# Altium schematic sheet 09_Power.SchDoc
size A3; SheetNumber: 10; SheetTotal: 13; SPICEModelCacheYARKVBEJ: <root> / <DocumentId>YARKVBEJ</DocumentId> / </root>
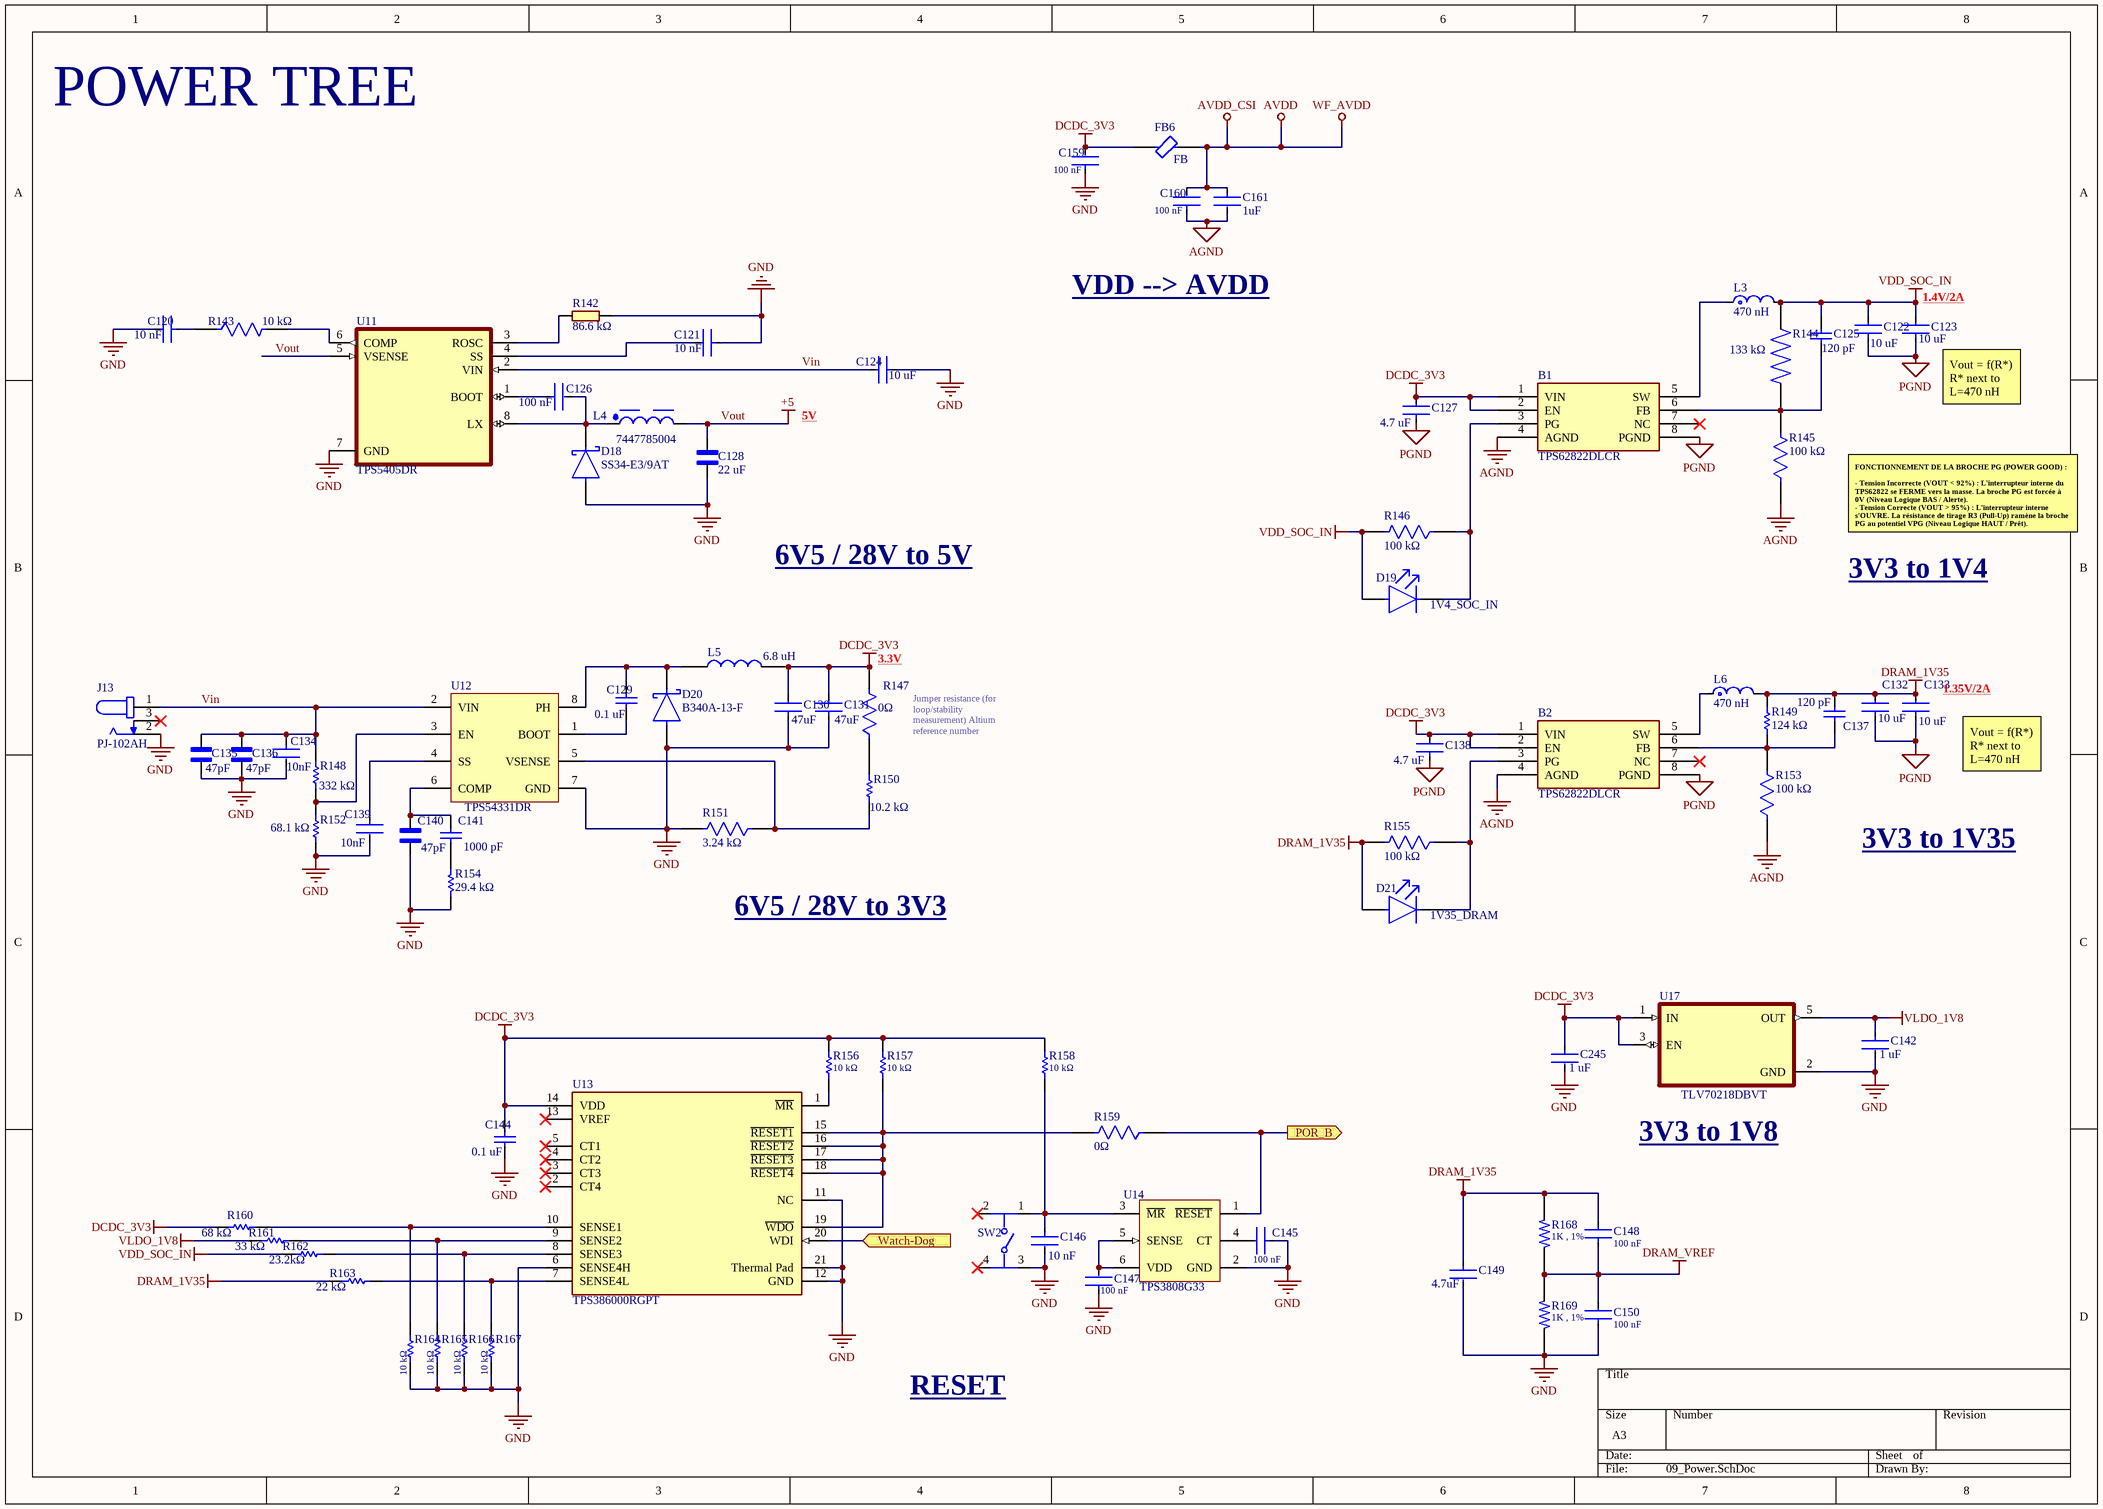
[diagram p0: 09_Power.SchDoc]

## Parts
B1  TPS62822DLCR  [SON50P150X200X100-8N]
B2  TPS62822DLCR  [SON50P150X200X100-8N]
C120  10 nF  [FP-CC0603-DA-MFG]
C121  10 nF  [FP-CC0603-DA-MFG]
C122  10 uF  [FP-GRM188-0_2-IPC_B]
C123  10 uF  [FP-GRM188-0_2-IPC_B]
C124  10 uF  [FP-GRM188-0_2-IPC_B]
C125  120 pF  [CAPC1608X90X35NL10T15]
C126  100 nF  [FP-CC0603-DA-MFG]
C127  4.7 uF  [FP-0603-L_1_6_0_2-W_0_8_0-IPC_B]
C128  22 uF  [CAPC3216X110N]
C129  0.1 uF  [CAPC1608X90X35ML10T15]
C130  47uF  [FP-GRM188-0_2-IPC_B]
C131  47uF  [FP-GRM188-0_2-IPC_B]
C132  10 uF  [FP-GRM188-0_2-IPC_B]
C133  10 uF  [FP-GRM188-0_2-IPC_B]
C134  10nF  [FP-CC0603-DA-MFG]
C135  47pF  [CAPC1608X90]
C136  47pF  [CAPC1608X90]
C137  120 pF  [CAPC1608X90X35NL10T15]
C138  4.7 uF  [FP-0603-L_1_6_0_2-W_0_8_0-IPC_B]
C139  10nF  [FP-CC0603-DA-MFG]
C140  47pF  [CAPC1608X90]
C141  1000 pF  [CAPC1608X90X35NL10T15]
C142  1 uF  [FP-CC0603-DA-MFG]
C144  0.1 uF  [CAPC1608X90X35ML10T15]
C145  100 nF  [FP-CC0603-DA-MFG]
C146  10 nF  [FP-CC0603-DA-MFG]
C147  100 nF  [FP-CC0603-DA-MFG]
C148  100 nF  [FP-CC0603-DA-MFG]
C149  4.7uF  [FP-CC0603-DA-MFG]
C150  100 nF  [FP-CC0603-DA-MFG]
C159  100 nF  [FP-CC0603-DA-MFG]
C160  100 nF  [FP-CC0603-DA-MFG]
C161  1uF  [FP-CC0603-DA-MFG]
C245  1 uF  [FP-CC0603-DA-MFG]
D18  SS34-E3/9AT  [FP-SMC-MFG]
D19  1V4_SOC_IN  [FP-HSMC-C280-MFG]
D20  B340A-13-F  [FP-SMA-MFG]
D21  1V35_DRAM  [FP-HSMG-C150-MFG]
FB6  FB  [FP-BLM18-0_15-t0_8-IPC_A]
J13  PJ-102AH  [CUI_PJ-102AH]
L3  470 nH  [FP-XFL4015-MFG]
L4  7447785004  [WE-PD_6033R]
L5  6.8 uH  [IND_SPM10054T_TDK]
L6  470 nH  [FP-XFL4015-MFG]
R142  86.6 kΩ  [0603]
R143  10 kΩ  [FP-RC0603-0_55-MFG]
R144  133 kΩ  [RESC1608X55N]
R145  100 kΩ  [FP-RC0603-0_55-MFG]
R146  100 kΩ  [FP-RC0603-0_55-MFG]
R147  0Ω  [FP-RC0603-MFG]
R148  332 kΩ  [RESC1608X55X25ML10T15]
R149  124 kΩ  [RESC1608X55X25NL10T15]
R150  10.2 kΩ  [RESC1608X55X25LL10T15]
R151  3.24 kΩ  [FP-CRCW0603-e3-IPC_A]
R152  68.1 kΩ  [RESC1608X55X25LL10T15]
R153  100 kΩ  [FP-RC0603-0_55-MFG]
R154  29.4 kΩ  [RESC1608X55X25ML10T15]
R155  100 kΩ  [FP-RC0603-0_55-MFG]
R156  10 kΩ  [RESC1608X55X25ML10T15]
R157  10 kΩ  [RESC1608X55X25ML10T15]
R158  10 kΩ  [RESC1608X55X25ML10T15]
R159  0Ω  [FP-RC0603-MFG]
R160  68 kΩ  [RESC1608X55X25LL10T15]
R161  33 kΩ  [RESC1608X55X25LL10T15]
R162  23.2kΩ  [RESC1608X55X25LL10T15]
R163  22 kΩ  [RESC1608X55X25ML10T15]
R164  10 kΩ  [RESC1608X55X25ML10T15]
R165  10 kΩ  [RESC1608X55X25ML10T15]
R166  10 kΩ  [RESC1608X55X25ML10T15]
R167  10 kΩ  [RESC1608X55X25ML10T15]
R168  1K , 1%  [RESC1607X60N]
R169  1K , 1%  [RESC1607X60N]
SW2  (no value)  [PTS645SM43SMTR92LFS_MFG]
U11  TPS5405DR  [SOIC127P599X175-8N]
U12  TPS54331DR  [D0008A_M]
U13  TPS386000RGPT  [FP-RGP0020A-MFG]
U14  TPS3808G33  [DBV6_M]
U17  TLV70218DBVT  [SOT95P280X145-5N]

## Ports
POR_B (out), Watch-Dog (in)

## Nets
AGND: B1.4(AGND) B2.4(AGND) C160.1 C161.2 R145.1 R153.1
AVDD: C160.2 C161.1 FB6.2  [also labelled AVDD_CSI, WF_AVDD]
DCDC_3V3: B1.1(VIN) B1.2(EN) B2.1(VIN) B2.2(EN) C127.2 C130.2 C131.2 C138.2 C144.1 C159.2 C245.1 FB6.1 L5.2 R147.2 R156.2 R157.2 R158.2 R160.1 U13.14(VDD) U17.1(IN) U17.3(EN)
DRAM_1V35: C132.2 C133.2 C137.2 C148.2 C149.1 D21.2(A) L6.2 R149.2 R155.2 R163.1 R168.2
DRAM_VREF: C148.1 C150.2 R168.1 R169.2
GND: C120.2 C121.1 C124.1 C128.1 C130.1 C131.1 C134.2 C135.2 C136.2 C139.2 C140.2 C142.2 C144.2 C145.1 C146.2 C147.1 C149.2 C150.1 C159.1 C245.2 D18.2(A) D20.2(A) J13.2 R142.2 R151.2 R152.1 R154.1 R164.1 R165.1 R166.1 R167.1 R169.1 SW2.3 U11.7(GND) U12.7(GND) U13.6(SENSE4H) U13.11(NC) U13.12(GND) U13.21(Thermal_Pad) U14.2(GND) U17.2(GND)
PGND: B1.8(PGND) B2.8(PGND) C122.1 C123.1 C127.1 C132.1 C133.1 C138.1
VDD_SOC_IN: C122.2 C123.2 C125.2 D19.2(A) L3.2 R144.2 R146.2 R162.1
VLDO_1V8: C142.1 R161.1 U17.5(OUT)
Vout: C128.2 L4.2 U11.5(VSENSE)  [also labelled +5]
POR_B: R159.1 U14.1(~{RESET}) ; port POR_B
Vin: C124.2 C134.1 C135.1 C136.1 J13.1 R148.2 U11.2(VIN) U12.2(VIN)
Watch-Dog: U13.20(WDI) ; port Watch-Dog
NetB1_3: B1.3(PG) D19.1(C) R146.1
NetB1_5: B1.5(SW) L3.1
NetB1_6: B1.6(FB) C125.1 R144.1 R145.2
NetB2_3: B2.3(PG) D21.1(C) R155.1
NetB2_5: B2.5(SW) L6.1
NetB2_6: B2.6(FB) C137.1 R149.1 R153.2
NetC120_1: C120.1 R143.1
NetC121_2: C121.2 U11.4(SS)
NetC126_1: C126.1 U11.1(BOOT)
NetC126_2: C126.2 D18.1(C) L4.1 U11.8(LX)
NetC129_1: C129.1 U12.1(BOOT)
NetC129_2: C129.2 D20.1(C) L5.1 U12.8(PH)
NetC139_1: C139.1 U12.4(SS)
NetC140_1: C140.1 C141.2 U12.6(COMP)
NetC141_1: C141.1 R154.2
NetC145_2: C145.2 U14.4(CT)
NetC146_1: C146.1 R158.1 SW2.1 U14.3(~{MR})
NetC147_2: C147.2 U14.5(SENSE) U14.6(VDD)
NetR142_1: R142.1 U11.3(ROSC)
NetR143_2: R143.2 U11.6(COMP)
NetR147_1: R147.1 R150.2
NetR148_1: R148.1 R152.2 U12.3(EN)
NetR150_1: R150.1 R151.1 U12.5(VSENSE)
NetR156_1: R156.1 U13.1(~{MR})
NetR157_1: R157.1 R159.2 U13.15(~{RESET1}) U13.16(~{RESET2}) U13.17(~{RESET3}) U13.18(~{RESET4}) U13.19(~{WDO})
NetR160_2: R160.2 R164.2 U13.10(SENSE1)
NetR161_2: R161.2 R165.2 U13.9(SENSE2)
NetR162_2: R162.2 R166.2 U13.8(SENSE3)
NetR163_2: R163.2 R167.2 U13.7(SENSE4L)

Not connected (* = marked no-connect by the designer): B1 7(NC)*; B2 7(NC)*; J13 3*; SW2 2* 4*; U13 2(CT4)* 3(CT3)* 4(CT2)* 5(CT1)* 13(VREF)*

## Notes on the sheet
- POWER TREE
- VDD --> AVDD
- (near C123) 1.4V/2A
- 5V
- (near C123) Vout = f(R*)
  R* next to L=470 nH
- 6V5 / 28V to 5V
- 3V3 to 1V4
- FONCTIONNEMENT DE LA BROCHE PG (POWER GOOD) :
  - Tension Incorrecte (VOUT < 92%) : L'interrupteur interne du TPS62822 se FERME vers la masse. La broche PG est forcée à 0V (Niveau Logique BAS / Alerte).
  - Tension Correcte (VOUT > 95%) : L'interrupteur interne s'OUVRE. La résistance de tirage R3 (Pull-Up) ramène la broche PG au potentiel VPG (Niveau Logique HAUT / Prêt).
- (near R147) 3.3V
- (near C133) 1.35V/2A
- Jumper resistance (for loop/stability measurement) Altium reference number
- (near C133) Vout = f(R*)
  R* next to L=470 nH
- 3V3 to 1V35
- 6V5 / 28V to 3V3
- (near U17) 3V3 to 1V8
- RESET

## Library data of the parts
B1 B2 = TPS62822DLCR: 2.4V-5.5V input, 2A step-down converter With 1% Accuracy in 1.5x2mm QFN; Manufacturer_Name: Texas Instruments; Geometry.Height: 1mm; Mouser Part Number: 595-TPS62822DLCR; Mouser Price/Stock: https://www.mouser.co.uk/ProductDetail/Texas-Instruments/TPS62822DLCR?qs=55YtniHzbhCS2IKlL8URbA%3D%3D; Manufacturer_Part_Number: TPS62822DLCR; Datasheet Link: http://www.ti.com/lit/gpn/tps62822
C120 C121 C134 C139 C146 = CMP-2100-03600-2: CAP CER 10000PF 50V X7R 0603; Manufacturer Part Number: CC0603KRX7R9BB103; Manufacturer: YAGEO; Tolerance: 0.1; Material: Ceramic; Temperature Coefficient: 15%; Mouser Description: Multilayer Ceramic Capacitor, CC Series, 0.01 - F, - 10%, X7R, 50 V, 0603 [1608 Metric]; Digikey Description: CAP CER 10000PF 50V X7R 0603; Height: 0.9mm; Category: Cap; Temperature Characteristic: X7R; Footprint Url: http://www.yageo.com/exep/pages/download/literatures/UPY-C_GEN_24.pdf; Lead Free: Yes; Voltage Rating: 50 V; Temperature: -55°C to +125°C; Device Class L3: Ceramic Capacitors; ComponentLink2Description: Datasheet; Voltage: 50 V; Package: CC0603-DA; Octopart: https://octopart.com/cc0603krx7r9bb103-yageo-192938; Automotive: No; Temperature Range High: +125°C; Temperature Range Low: -55°C; Value: 10 nF; RoHS: TRUE; Device Class L1: Passive Components; ComponentLink2URL: http://www.yageo.com/documents/recent/UPY-GPHC_X7R_6.3V-to-50V_18.pdf; Device Class L2: Capacitors; Capacitance: 10 nF
C122-C124 C132 C133 = CMP-06035-036920-1: Chip Multilayer Ceramic Capacitors for General Purpose, 0603, 10uF, X7R, 15%, 20%, 10V; Case/Package: 0603
C125 C137 = CMP-2006-02605-1: Manufacturer: Murata; Part Number: GRM1885C1H121JA01D
C126 C145 C147 C148 C150 C159 C160 = CMP-2100-03601-2: CAP CER 0.1UF 50V X7R 0603; Manufacturer: YAGEO; Manufacturer Part Number: CC0603KRX7R9BB104; Material: Ceramic; Temperature Coefficient: 15%; Tolerance: 0.1; Height: 0.9mm; Voltage: 50 V; ComponentLink2Description: Datasheet; Device Class L2: Capacitors; Temperature Range High: +125°C; Category: Cap; Capacitance: 100 nF; Footprint Url: http://www.yageo.com/exep/pages/download/literatures/UPY-C_GEN_24.pdf; ComponentLink2URL: http://www.yageo.com/documents/recent/UPY-GPHC_X7R_6.3V-to-50V_18.pdf; Package: CC0603-DA; Temperature: -55°C to +125°C; Voltage Rating: 50 V; Temperature Characteristic: X7R; Device Class L1: Passive Components; Temperature Range Low: -55°C; RoHS: TRUE; Automotive: No; Value: 100 nF; Device Class L3: Ceramic Capacitors; Octopart: https://octopart.com/cc0603krx7r9bb104-yageo-42244635; Mouser Description: Multilayer Ceramic Capacitor, CC Series, 0.1 - F, - 10%, X7R, 50 V, 0603 [1608 Metric]; Lead Free: Yes; Digikey Description: CAP CER 0.1UF 50V X7R 0603
C127 C138 = CMP-14477-004372-2: Multilayer Ceramic Capacitor 4.7uF 6.3V X7R 20% SMD 0603 T/R; Max Operating Temperature: 125°C; Mount: Surface Mount; Voltage Rating: 6.3V; Case Code (Imperial): 0603; RoHS Compliant: Yes; Packaging: Cut Tape; Case Code (Metric): 1608; Case/Package: 0603; Tolerance: 20%; Capacitance: 4.7uF; Min Operating Temperature: -55°C
C128 = C1206C226K8RACTU: 22 ÂµF Â±10% 10V Ceramic Capacitor X7R 1206 (3216 Metric); MF: KEMET; SnapEDA_Link: https://www.snapeda.com/parts/C1206C226K8RACTU/KEMET/view-part/?ref=snap; Package: 1206-2 KEMET; Value: *; MP: C1206C226K8RACTU; Check_prices: https://www.snapeda.com/parts/C1206C226K8RACTU/KEMET/view-part/?ref=eda
C129 C144 = CMP-2006-02375-5: Chip Capacitor, 100 nF, +/- 10%, 50 V, -55 to 125 degC, 0603 (1608 Metric), RoHS, Tape and Reel; Manufacturer: Murata; Voltage Rating: 50 V; Min Operating Temperature: -55 degC; ComponentLink1URL: http://www.murata.com/; PackageReference: 0603; Max Operating Temperature: 125 degC; ComponentLink1Description: Manufacturer URL; ComponentLink2Description: Datasheet; Packaging: Tape and Reel; PackageDescription: 2-Pin Surface Mount Device, Body 1.6 x 0.8 mm; Height: 0.8 mm; Mounting Technology: Surface Mount; Mount: Surface Mount; Length: 1.6 mm; ComponentLink2URL: http://psearch.en.murata.com/capacitor/product/GCM188R71H104KA57%23.pdf; Package Quantity: 4000; REACH SVHC: No SVHC; RoHSCompliant: true; DatasheetVersion: 07/2016
C130 C131 = CMP-2000-05444-2: Chip Multilayer Ceramic Capacitors for General Purpose, 0603, 47uF, X5R, 15%, 20%, 6.3V; Voltage Rating (DC): 6.3V; Thickness: 0.039inch; Case Code (Imperial): 0603; Packaging: Tape and Reel; Capacitance: 47uF; Width: 0.031inch; Dielectric: X5R; Max Operating Temperature: 85°C; Mount: Surface Mount; Case Code (Metric): 1608; Length: 0.063inch; Voltage Rating: 6.3V; Tolerance: 20%; Case/Package: 0603; Min Operating Temperature: -55°C
C135 C136 C140 = CC0603JRNPO9BN470: 47 pF Â±5% 50V Ceramic Capacitor C0G, NP0 0603 (1608 Metric); MF: Yageo; SnapEDA_Link: https://www.snapeda.com/parts/CC0603JRNPO9BN470/Yageo/view-part/?ref=snap; Package: 0603 Yageo; Value: *; MP: CC0603JRNPO9BN470; Check_prices: https://www.snapeda.com/parts/CC0603JRNPO9BN470/Yageo/view-part/?ref=eda
C141 = CMP-2006-02891-1: Part Number: GRM188R71H102KA01D; Manufacturer: Murata
C142 C161 C245 = CMP-03422-000162-1: CAP CER 1UF 10V X5R 0603; Manufacturer Part Number: CC0603KRX5R6BB105; Manufacturer: YAGEO; Material: Ceramic; Tolerance: 0.1; Temperature Coefficient: 15%; ComponentLink2Description: Datasheet; Capacitance: 1 uF; Device Class L2: Capacitors; Package: CC0603-DA; Digikey Description: CAP CER 1UF 10V X5R 0603; Device Class L1: Passive Components; Footprint Url: http://www.yageo.com/exep/pages/download/literatures/UPY-C_GEN_24.pdf; Octopart: https://octopart.com/cc0603krx5r6bb105-yageo-8376527; Category: Cap; Voltage: 10 V; Automotive: No; RoHS: TRUE; Temperature Range High: +125°C; ComponentLink2URL: http://www.yageo.com/documents/recent/UPY-GPHC_X7R_6.3V-to-50V_18.pdf; Value: 1 uF; Mouser Description: Multilayer Ceramic Capacitors MLCC - SMD/SMT 1.0uF 10V X5R 10%; Voltage Rating: 10 V; Height: 0.9mm; Temperature Range Low: -55°C; Device Class L3: Ceramic Capacitors; Temperature: -55°C to +125°C; Temperature Characteristic: X5R; Lead Free: Yes
C149 = CMP-2000-06074-2: CAP CER 4.7UF 10V X5R 0603; Manufacturer Part Number: CC0603KRX5R6BB475; Manufacturer: YAGEO; Temperature Coefficient: 15%; Tolerance: 0.1; Material: Ceramic; Voltage Rating: 10 V; ComponentLink2URL: http://www.yageo.com/documents/recent/UPY-GPHC_X7R_6.3V-to-50V_18.pdf; Package: CC0603-DA; Temperature Range High: +125°C; Category: Cap; ComponentLink2Description: Datasheet; Lead Free: Yes; Mouser Description: 4.7µF Surface Mount, MLCC 0603 (1608 Metric) Package Ceramic Capacitors; Device Class L2: Capacitors; Temperature Characteristic: X5R; Voltage: 10 V; RoHS: TRUE; Octopart: https://octopart.com/cc0603krx5r6bb475-yageo-9292507; Automotive: No; Height: 0.9mm; Temperature: -55°C to +125°C; Temperature Range Low: -55°C; Value: 4.7 uF; Digikey Description: CAP CER 4.7UF 10V X5R 0603; Device Class L1: Passive Components; Capacitance: 4.7 uF; Footprint Url: http://www.yageo.com/exep/pages/download/literatures/UPY-C_GEN_24.pdf; Device Class L3: Ceramic Capacitors
D18 = CMP-02539-000066-1: DIODE SCHOTTKY 40V 3A DO214AB; Peak Non-Repetitive Surge Current: 100A; Forward Voltage: 500mV; Element Configuration: Single; Max Reverse Current: 500uA; Case/Package: SMC; Radiation Hardening: No; Series: -; Max Surge Current: 100A; RoHS Compliant: Yes; Min Operating Temperature: -55°C; Average Rectified Current: 3A; Max Reverse Leakage Current: 500uA; Package Quantity: 3500; Max Reverse Voltage (DC): 40V; Forward Current: 3A; Packaging: Tape and Reel; Max Operating Temperature: 125°C; Max Repetitive Reverse Voltage (Vrrm): 40V; Number of Pins: 2; Mount: Surface Mount
D19 = CMP-18399-000022-1: LED RED DIFFUSED 0402 SMD; Dominant Wavelength: 626nm; Number of Elements: 1; Luminous Intensity: 90mcd; Viewing Angle: 130°; Reverse Voltage: 5V; Forward Current: 20mA; Lens Color: White; Power Rating: 60mW; Forward Voltage: 1.9V; Luminous Flux: 155lm; Contact Plating: Gold; Number of Pins: 2; REACH SVHC: No SVHC; Lens Style: Diffused; Color: Red; Packaging: Tape and Reel; Max Operating Temperature: 85°C; Radiation Hardening: No; Length: 1mm; Number of LEDs: 1; Case/Package: 0402; Min Operating Temperature: -40°C; Case Code (Metric): 1005; Case Code (Imperial): 0402; Test Current: 20mA; Lead Free: Lead Free; Height: 0.4mm; Illumination Color: Red; Max Power Dissipation: 60mW; Package Quantity: 4000; Mount: Surface Mount; Wavelength: 626nm; Depth: 0.5mm; Lens Transparency: Diffused; Power Dissipation: 60mW; Width: 0.5mm
D20 = CMP-1667-00003-3: DIODE SCHOTTKY 40V 3A SMA; Max Forward Surge Current (Ifsm): 80A; Forward Voltage: 500mV; Polarity: Standard; Max Reverse Current: 500uA; Capacitance: 250pF; Element Configuration: Single; Mount: Surface Mount; Output Current: 3A; Radiation Hardening: No; Width: 2.92mm; Current Rating: 3A; Termination: SMD/SMT; Voltage: 40V; Series: -; Max Operating Temperature: 125°C; Current: 3A; Max Repetitive Reverse Voltage (Vrrm): 40V; Min Operating Temperature: -55°C; REACH SVHC: No SVHC; Number of Pins: 2; Average Rectified Current: 3A; Contact Plating: Tin; RoHS Compliant: Yes; Max Reverse Voltage (DC): 40V; Packaging: Tape and Reel; Height: 2.3mm; Length: 4.6mm; Case/Package: SMA; Weight: 0.002258oz; Peak Non-Repetitive Surge Current: 80A; Package Quantity: 5000; Lead Free: Lead Free; Forward Current: 3A; Voltage Rating (DC): 40V
D21 = CMP-2000-05061-2: LED GREEN DIFFUSED 1206 SMD; Manufacturer Part Number: HSMG-C150; Manufacturer: Broadcom; Led Orientation: Top View; Max Junction Temp: +95°C; Peak Emmision Wavelength: 570nm; Viewing Angle: 170°; Wavelength: 572nm; Reverse Voltage: 5V; Luminous Intensity: 15mcd; Forward Voltage: 2.2V; Power Dissipation: 65mW; Forward Current: 20mA; ComponentLink2Description: Datasheet; Lead Free: Yes; Temperature Range Low: -40°C; Package: HSMG-C150; Digikey Description: LED GREEN DIFFUSED 1206 SMD; Mouser Description: LED Uni-Color Green 570nm 2-Pin Chip LED T/R; Temperature Range High: +85°C; Device Class L1: Optoelectronics; Colour: Green; Category: Diode; Device Class L3: unset; RoHS: TRUE; Height: 1.2mm; ComponentLink2URL: https://docs.broadcom.com/docs/AV02-0551EN; Device Class L2: LEDs; Automotive: No; Ipc Land Pattern Name: DIOCP320160X55; Octopart: https://octopart.com/hsmg-c150-broadcom-71131304; Temperature: -40°C to +85°C
FB6 = CMP-0686-00368-3: Chip Ferrite Bead, 0603, 1500Ω @ 100MHz, 0.5Ω, 25%, 500mA; Impedance: 1.5kR; DC Resistance (DCR): 500mR; Number of Circuits: 1; Test Frequency: 100MHz; Case/Package: 0603; Max Operating Temperature: 125°C; Package Quantity: 1; Max DC Current: 500mA; Tolerance: 25%; Core Material: Ferrite; Width: 0.8mm; Number of Pins: 2; Depth: 0.8mm; Radiation Hardening: No; Case Code (Imperial): 0603; Min Operating Temperature: -55°C; Termination: SMD/SMT; Material: Ferrite; Military Standard: Not; Number of Lines: 1; DC Current: 500mA; Length: 1.6mm; REACH SVHC: No SVHC; Lead Free: Lead Free; Current Rating: 500mA; Max Current Rating: 500mA; Packaging: Tape and Reel; Case Code (Metric): 1608; Height: 0.8mm
J13 = PJ-102AH: 2.0 x 6.5 mm, 5.0 A, Horizontal, Through Hole, Tapered Pins, Dc Power Jack Connector; MF: Same Sky; SnapEDA_Link: https://www.snapeda.com/parts/PJ-102AH/Same+Sky/view-part/?ref=snap; Package: None; Value: *; MP: PJ-102AH; Check_prices: https://www.snapeda.com/parts/PJ-102AH/Same+Sky/view-part/?ref=eda
L3 L6 = CMP-11268-000114-1: Surface Mount Power Inductor, XFL4015 Series, 470 nH, 20%, Shielded, 8360 ohm, 11.2 A; RMS Current (Irms): 11.2A; Inductance: 470nH; Core Material: Composite; Test Frequency: 100kHz; Self Resonant Frequency: 89MHz; Saturation Current: 3.5A; DC Resistance (DCR): 8.36mR; Case/Package: SMD/SMT; Min Operating Temperature: -40°C; Tolerance: 20%; Inductance Tolerance: 20%; Height: 1.6mm; Shielding: Shielded; REACH SVHC: No SVHC; Series: XFL4015; Lead Free: Contains Lead; Termination: SMD/SMT; Mount: Surface Mount; Package Quantity: 40; Width: 4.3mm; Max DC Current: 11.2A; Packaging: Tape and Reel; Max Operating Temperature: 125°C; Length: 4.3mm; RoHS Compliant: Yes
L4 = CMP-0227-00287-3: General Purpose Inductor, 4.7uH, 25%, 1 Element, Ferrite-Core, SMD, 2423; Self Resonant Frequency: 53MHz; Shielding: Shielded; Saturation Current: 2.5A; Inductance: 4.7µH; Max DC Current: 2.2A; RMS Current (Irms): 2.65A; DC Resistance (DCR): 60mΩ; Test Frequency: 100kHz; Length: 5.9mm; Case/Package: Nonstandard; Weight: 4.535924g; Composition: Wirewound; Ambient Temperature Range High: 85°C; Mount: Surface Mount; Case Code (Metric): 1608; Termination: SMD/SMT; Height: 3.3mm; Height - Seated (Max): 3.302mm; Inductance Tolerance: 25%; RoHS: Compliant; Width: 6.2mm; Ambient Temperature Range Low: -40°C; Number of Pins: 2; Case Code (Imperial): 0603; Tolerance: 25%; Core Material: Ferrite; Max Operating Temperature: 125°C; Current Rating: 2.2A; Min Operating Temperature: -40°C
L5 = SPM10054T-6R8M-HZR: Power Inductors - SMD 6.8uH 20% 23.21mOhms AEC-Q200; Manufacturer_Name: TDK; Geometry.Height: 5.4mm; Mouser Part Number: 810-SPM100546R8MHZR; Mouser Price/Stock: https://www.mouser.co.uk/ProductDetail/TDK/SPM10054T-6R8M-HZR?qs=amGC7iS6iy9gvgvDUBtU5w%3D%3D; Manufacturer_Part_Number: SPM10054T-6R8M-HZR; Datasheet Link: https://product.tdk.com/system/files/dam/doc/product/inductor/inductor/smd/catalog/inductor_automotive_power_spm10054-hzr_en.pdf
R142 = RC0603FR-0786K6L: 86.6 kOhms Â±1% 0.1W, 1/10W Chip Resistor 0603 (1608 Metric) Moisture Resistant Thick Film; MF: Yageo; SnapEDA_Link: https://www.snapeda.com/parts/RC0603FR-0786K6L/Yageo/view-part/?ref=snap; Package: SMD-2 Yageo; Value: *; MP: RC0603FR-0786K6L; Check_prices: https://www.snapeda.com/parts/RC0603FR-0786K6L/Yageo/view-part/?ref=eda
R143 = CMP-2100-03664-2: RES 10K OHM 1% 1/10W 0603; Voltage Rating: 75V; Voltage Rating (DC): 50V; Resistance: 10kR; Power Rating: 100mW; Temperature Coefficient: 100ppm/°C; Depth: 0.8mm; Termination: SMD/SMT; Resistor Type: Thick Film; Series: RC; Construction: Rectangular; Features: Moisture Resistant; Packaging: Tape and Reel; Min Operating Temperature: -55°C; Number of Terminations: 2; Lead Pitch: 0.3mm; RoHS Compliant: Yes; Case/Package: 0603; Resistance Tolerance: 1%; Military Standard: Not; Weight: 7.1E-05oz; Number of Pins: 2; Tolerance: 1%; Length: 1.6mm; Case Code (Imperial): 0603; Lead Free: Lead Free; Width: 0.8mm; Max Power Dissipation: 100mW; Height: 0.45mm; Max Operating Temperature: 155°C; Case Code (Metric): 1608; Size Code: 0603
R144 = RC0603FR-07133KL: 133 kOhms Â±1% 0.1W, 1/10W Chip Resistor 0603 (1608 Metric) Moisture Resistant Thick Film; MF: Yageo; SnapEDA_Link: https://www.snapeda.com/parts/RC0603FR-07133KL/Yageo/view-part/?ref=snap; Package: 1608 Yageo; Value: *; MP: RC0603FR-07133KL; Check_prices: https://www.snapeda.com/parts/RC0603FR-07133KL/Yageo/view-part/?ref=eda
R145 R146 R153 R155 = CMP-2100-03662-2: RES SMD 100K OHM 1% 1/10W 0603; Voltage Rating (DC): 50V; Resistance: 100kR; Max Power Dissipation: 100mW; Temperature Coefficient: 100ppm/°C; Working Voltage: 75V; Length: 1.6mm; Lead Free: Lead Free; Number of Terminations: 2; Packaging: Tape and Reel; Voltage Rating: 50V; Termination: SMD/SMT; Width: 0.8mm; Resistor Type: Thick Film; Resistance Tolerance: 1%; Features: Moisture Resistant; Height: 0.45mm; Construction: Rectangular; Case/Package: 0603; Military Standard: Not; Case Code (Imperial): 0603; Series: RC; Technology: THICK FILM; Depth: 0.8mm; RoHS Compliant: Yes; REACH SVHC: No SVHC; Min Operating Temperature: -55°C; Case Code (Metric): 1608; Max Operating Temperature: 155°C; Power Rating: 100mW; Number of Pins: 2; Tolerance: 1%
R147 R159 = CMP-2000-06925-2: RES SMD 0 OHM JUMPER 1/10W 0603; Manufacturer: Yageo; Manufacturer Part Number: RC0603FR-070RL; Tolerance: 1%; Power Rating: 0.1W; Voltage Rating: 75V; Composition: Thick Film; Temperature Range Low: -55°C; Ipc Land Pattern Name: RESC16080X45; Lead Free: Yes; Digikey Description: RES SMD 0 OHM JUMPER 1/10W 0603; Height: 0.55mm; Automotive: No; Device Class L3: Chip SMD Resistors; Device Class L1: Passive Components; Device Class L2: Resistors; Footprint Url: http://www.yageo.com/exep/pages/download/literatures/PYu-R_Mount_10.pdf; Category: Res; Mouser Description: RC Series 0603 0.1 W 0 O Jumper Surface Mount Thick Film Chip Resistor; Value: 0Ω; Resistance: 0Ω; ComponentLink2URL: http://www.yageo.com/documents/recent/PYu-RC_Group_51_RoHS_L_10.pdf; Series: RC_L; ComponentLink2Description: Datasheet; RoHS: TRUE; Temperature: -55°C to +155°C; Temperature Range High: +155°C; Package: RC0603; Octopart: https://octopart.com/rc0603fr-070rl-yageo-1180803
R148 = CMP-1659-00021-2: Chip Resistor, 332 KOhm, +/- 1%, 0.1 W, -55 to 155 degC, 0603 (1608 Metric), RoHS, Tape and Reel; Gender: Female; Voltage Rating: 40 V; Case\Package: Metal; Connector Type: HDMI; Mount: Surface Mount; Packaging: Tape and Reel; ComponentLink1URL: http://www.yageo.com/; Length: 15 mm; Colour: Silver; Height: 14.25 mm; Pins: 19; Package Quantity: 300; PackageReference: 0603; Contact Plating: Gold; ComponentLink2URL: http://www.yageo.com/documents/recent/PYu-RC_Group_51_RoHS_L_04.pdf; Lead Pitch: 0.5 mm; Width: 11.55 mm; ComponentLink2Description: Datasheet; PackageDescription: 2-Pin Surface Mount Device, Body 1.6 x 0.8 mm; RoHSCompliant: true; REACH SVHC: No SVHC; DatasheetVersion: Rev. 4, 02/2016; Contact Material: Copper; ComponentLink1Description: Manufacturer URL
R149 = CMP-2000-04894-1: Manufacturer: Yageo; Part Number: RC0603FR-07124KL
R150 = CMP-2000-06926-1: Chip Resistor, 10.2 KOhm, +/- 1%, 0.1 W, -55 to 155 degC, 0603 (1608 Metric), RoHS, Tape and Reel; Brand: Yageo; Power Rating: 100mW; Voltage Rating: 75V; Resistance: 10.2kOhms; Unit Weight: 0.000071oz; Temperature Coefficient: 100PPM/C; Package Reference: 0603; Product: ThickFilmResistorsGeneralPurpose; Series: RC; Tolerance: 1%; Datasheet Version: Rev. 7, 05/2017; Case Code - in: 0603; Packaging: Reel; Manufacturer URL: http://www.yageo.com/; Manufacturer: Yageo; Package / Case: 0603(1608metric); Width: 0.8mm; Operating Temperature Range: -55Cto+155C; Package Description: 2-Pin Surface Mount Device, Body 1.6 x 0.8 mm; RoHS: True; Height: 0.45mm; Termination Style: SMD/SMT; Product Category: ThickFilmResistors; Type: GeneralPurposeChipResistorSurfaceMount; Case Code - mm: 1608; Datasheet URL: http://www.yageo.com/documents/recent/PYu-RC_Group_51_RoHS_L_7.pdf; Length: 1.6mm; Mounting Technology: SurfaceMount
R151 = CMP-2000-03299-2: RES Thick Film, 3.24kΩ, 1%, 0.1W, 100ppm/°C, 0603; Voltage Rating: 75V; Resistance: 3.24kR; Power Rating: 100mW; Depth: 0.85mm; Features: Automotive AEC-Q200; Case/Package: 0603; Number of Terminations: 2; Max Operating Temperature: 155°C; Min Operating Temperature: -55°C; Tolerance: 1%; Case Code (Imperial): 0603; Working Voltage: 75V; Width: 0.85mm; Number of Pins: 2; Military Standard: Not; Contact Plating: Tin; Termination: SMD/SMT; Radiation Hardening: No; Length: 1.55mm; Packaging: Tape and Reel; Case Code (Metric): 1608; Composition: Thick Film; Height: 0.45mm; Temperature Coefficient: 100ppm/°C; Max Power Dissipation: 100mW; Package Quantity: 10; Weight: 7.1E-05oz; Mount: Surface Mount
R152 = CMP-2000-04112-1: Part Number: RC0603FR-0768K1L; Manufacturer: Yageo
R154 = CMP-2000-03981-1: Part Number: RC0603FR-0729K4L; Manufacturer: Yageo
R156-R158 R164-R167 = CMP-2000-05022-1: Resistor, 10 KOhm, +/- 5%, 100 mW, -55 to 155 degC, 0603 (1608 Metric), RoHS, Tape and Reel; Manufacturer: Yageo; Resistance: 10kOhms; Voltage Rating: 50V; Temperature Coefficient: 100PPM/C; Power Rating: 100mW; Package Reference: 603; Series: RC; Case Code - mm: 1608; Packaging: Reel; Datasheet URL: http://www.farnell.com/datasheets/443971.pdf; Datasheet Version: Rev. 4, 04/2009; Operating Temperature Range: -55Cto+155C; Product: ThickFilmResistorsGeneralPurpose; Package Description: 2-Pin Surface Mount Device, Body 1.6 x 0.8 mm; Manufacturer URL: http://www.yageo.com/; Case Code - in: 0603; Tolerance: 5%; Termination Style: SMD/SMT
R160 = CMP-2000-06944-1: Chip Resistor, 68 KOhm, +/- 1%, 0.1 W, -55 to 155 degC, 0603 (1608 Metric), RoHS, Tape and Reel; Manufacturer: Yageo; Temperature Coefficient: 100PPM/C; Power Rating: 100mW; Resistance: 68kOhms; Voltage Rating: 50V; Termination Style: SMD/SMT; Case Code - mm: 1608; Mounting Technology: SurfaceMount; Packaging: Reel; Series: RC; Product: ThickFilmResistorsGeneralPurpose; Operating Temperature Range: -55Cto+155C; Datasheet URL: http://www.yageo.com/documents/recent/PYu-RC_Group_51_RoHS_L_7.pdf; Package Reference: 0603; Manufacturer URL: http://www.yageo.com/; Datasheet Version: Rev. 7, 05/2017; Package Description: 2-Pin Surface Mount Device, Body 1.6 x 0.8 mm; Case Code - in: 0603; Tolerance: 1%
R161 = CMP-2000-06938-1: Chip Resistor, 33 KOhm, +/- 1%, 0.1 W, -55 to 155 degC, 0603 (1608 Metric), RoHS, Tape and Reel; Manufacturer: Yageo; Voltage Rating: 50V; Power Rating: 100mW; Resistance: 33kOhms; Temperature Coefficient: 100PPM/C; Datasheet Version: Rev. 7, 05/2017; Case Code - in: 0603; Product: ThickFilmResistorsGeneralPurpose; Tolerance: 1%; Case Code - mm: 1608; Manufacturer URL: http://www.yageo.com/; Datasheet URL: http://www.yageo.com/documents/recent/PYu-RC_Group_51_RoHS_L_7.pdf; Termination Style: SMD/SMT; Package Description: 2-Pin Surface Mount Device, Body 1.6 x 0.8 mm; Series: RC; Packaging: Reel; Mounting Technology: SurfaceMount; Operating Temperature Range: -55Cto+155C; Package Reference: 0603
R162 = CMP-2000-03962-1: Part Number: RC0603FR-0723K2L; Manufacturer: Yageo
R163 = CMP-1012-00659-3: Chip Resistor, 22 KOhm, +/- 1%, 0.1 W, -55 to 155 degC, 0603 (1608 Metric), RoHS, Tape and Reel; Tolerance: 10%; Current Rating: 290 mA; Shielding: Unshielded; Resistance: 2.9 Ohm; PackageReference: 0603; PackageDescription: 2-Pin Surface Mount Device, Body 1.6 x 0.8 mm; ComponentLink2URL: http://www.yageo.com/documents/recent/PYu-RC_Group_51_RoHS_L_04.pdf; RoHSCompliant: True; REACH SVHC: No SVHC; ComponentLink1Description: Manufacturer URL; ComponentLink2Description: Datasheet; DatasheetVersion: Rev. 4, 02/2016; Min Operating Temperature: -55degC; Pins: 2; Mount: Through Hole; Height: 11 mm; Packaging: Bulk; Radiation Hardening: No; Package Quantity: 100; Diameter: 8.5 mm; Lead Pitch: 5 mm; Case/Package: Radial; Max Operating Temperature: 105degC; ComponentLink1URL: http://www.yageo.com/
R168 R169 = RC0603FR-071KL: 1 kOhms Â±1% 0.1W, 1/10W Chip Resistor 0603 (1608 Metric) Moisture Resistant Thick Film; MF: Yageo; SnapEDA_Link: https://www.snapeda.com/parts/RC0603FR-071KL/Yageo/view-part/?ref=snap; Package: 0603 Yageo; Value: *; MP: RC0603FR-071KL; Check_prices: https://www.snapeda.com/parts/RC0603FR-071KL/Yageo/view-part/?ref=eda
SW2 = CMP-2000-05160-3: Switch Tactile N.O SPST Round Button Gull Wing 0.05A 12VDC 100000Cycle 1.57N SMD T/R; Manufacturer Package Identifier: PTS645SM43SMTR92LFS; Switch Function: Off-Mom; Life (Cycles): 100kcycles; Voltage Rating (DC): 12V; Actuator Material: Nylon, Polyamide; Max Current Rating: 50mA; Contact Resistance: 100mΩ; Number of Positions: 1; Actuator Length: 850µm; Illumination Type: Illuminated, Non-Illuminated; Insulation Resistance: 100GΩ; RoHS: Compliant; Electrical Life: 100kcycles; Lead Free: Lead Free; Contact Plating: Silver; Case/Package: SMD/SMT; Termination: Solder; Height: 3.45mm; ComponentLink1URL: http://www.ck-components.com/; Max Voltage Rating (DC): 12V; Lifecycle Status: Production; Min Operating Temperature: -20°C; Throw Configuration: SPST; China RoHS: Compliant; ComponentLink1Description: Manufacturer's Website; Operating Force: 1.57N; Depth: 9mm; Contact Material: Silver; Length: 6mm; Current Rating: 50mA; Color: Black; Contact Current Rating: 50mA; Mechanical Life: 100kcycles; ComponentLink2URL: https://www.ckswitches.com/media/1471/pts645.pdf; Orientation: Straight; Packaging: Cut Tape (CT); REACH SVHC: Yes; Max Operating Temperature: 60°C; ComponentLink2Description: Datasheet URL; HelpURL: https://www.ckswitches.com/media/1471/pts645.pdf; Mount: Surface Mount
U11 = TPS5405DR: 6.5V to 28V Input, 5V Fixed Output at 2A Step-Down Regulator with Intregrated MosFET; MF: Texas Instruments; SnapEDA_Link: https://www.snapeda.com/parts/TPS5405DR/Texas+Instruments/view-part/?ref=snap; Package: SOIC-8 Texas Instruments; Value: *; MP: TPS5405DR; Check_prices: https://www.snapeda.com/parts/TPS5405DR/Texas+Instruments/view-part/?ref=eda
U12 = CMP-0323-00209-3: Buck Step Down Regulator with 3.5 to 28 V Input and 0.8 to 25 V Output, -40 to 150 degC, 8-Pin SOIC (D), Green (RoHS & no Sb/Br); Manufacturer: Texas Instruments; Vin(Max)(V): 28; Duty Cycle(Max)(%): 90; Vin(Min)(V): 3.5; Iq(Typ)(mA): 0.11; SubFamily: Step-Down Regulator; Rating: Catalog; Iout(Max)(A): 3; Regulated Outputs(#): 1; Vout(Max)(V): 25; Vout(Min)(V): 0.8; Code_JEDEC: MS-012AA; DatasheetVersion: SLVS839D; ComponentLink3Description: URL Link1; Topology: Buck; ComponentLink2URL: http://www.ti.com/litv/pdf/msoi002j; Eco-Plan: Green (RoHS & no Sb/Br); ComponentLink1URL: http://www.ti.com/general/docs/lit/getliterature.tsp?genericPartNumber=TPS54331&fileType=pdf; Mounting Technology: Surface Mount; PartNumber: TPS54331DR; ComponentLink3URL: Samples URL:http://www.ti.com/product/tps54331#samples; ComponentLink1Description: Datasheet; PackageVersion: revM, Jun-2011; ComponentLink2Description: Package Specification; PackageDescription: 8-Pin Plastic Small Outline Integrated Circuit, 4.9 x 3.9 mm, Pitch 1.27 mm Pitch; Switch Current Limit(Typ)(A): 3.5; PackageReference: D0008A
U13 = CMP-04919-000038-1: IC SUPERVISOR 4 CHANNEL 20QFN; Max Power Dissipation: 2.86W; Max Supply Voltage: 6.5V; Overvoltage Threshold: 400mV; Number of Voltages Monitored: 4; Reset: Active Low; Max Reset Threshold Voltage: 404mV; Nominal Supply Current: 13uA; Quiescent Current: 12uA; Max Output Current: 1mA; Watchdog Timer: Yes; Min Reset Threshold Voltage: 396mV; Accuracy: 0.25%; Min Supply Voltage: 1.8V; Length: 4.15mm; Radiation Hardening: No; Number of Pins: 20; Type: Multi-Voltage Supervisor; Packaging: Tape and Reel; Power Dissipation: 2.86W; Max Operating Temperature: 125°C; Lead Free: Lead Free; Case/Package: QFN; Termination: SMD/SMT; RoHS Compliant: Yes; Min Operating Temperature: -40°C; REACH SVHC: No SVHC; Width: 4.15mm; Threshold Voltage: 400mV; Package Quantity: 1; Mount: Surface Mount; Operating Supply Current: 13uA; Height: 0.95mm
U14 = CMP-0332-00499-1: Low Quiescent Current, Programmable-Delay Supervisory Circuit, 1 Supply Monitored, -40 to 125 degC, 6-pin SOT-23 (DBV), Green (RoHS & no Sb/Br); Manufacturer: Texas Instruments; PartNumber: TPS3808G33DBVTG4; VCC(Max)(V): 6.5; SubFamily: Supervisor and Reset IC; Output Driver Type / Reset Output: Active-low, Open-drain; # of supplies monitored: 1; Iq(Typ)(uA): 2.4; Threshold Voltage 1 (typ)(Typ)(V): 3.07; Rating: Catalog; VCC(Min)(V): 1.7; Reset Threshold Accuracy(%): 0.5; PackageVersion: revK, Mar-2006; Time Delay(ms): Programmable; PackageDescription: 6-Pin Plastic Small-Outline Package, 2.9 x 1.6 mm Body, 0.95 mm Pitch, 2.8 mm Lead Span; DatasheetVersion: SBVS050J; ComponentLink1URL: http://www.ti.com/general/docs/lit/getliterature.tsp?genericPartNumber=TPS3808G33&fileType=pdf; Code_JEDEC: MO-178-AB*; Mounting Technology: Surface Mount; ComponentLink1Description: Datasheet; PackageReference: DBV6
U17 = TLV70218DBVT: 300-mA, high-PSRR, low-IQ, low-dropout voltage regulator with enable; MF: Texas Instruments; SnapEDA_Link: https://www.snapeda.com/parts/TLV70218DBVT/Texas+Instruments/view-part/?ref=snap; Package: SOT-23-5 Texas Instruments; Value: *; MP: TLV70218DBVT; Check_prices: https://www.snapeda.com/parts/TLV70218DBVT/Texas+Instruments/view-part/?ref=eda